# Altium project PowerBackup-v2.1.1.PrjPcb (part 1 of 2)
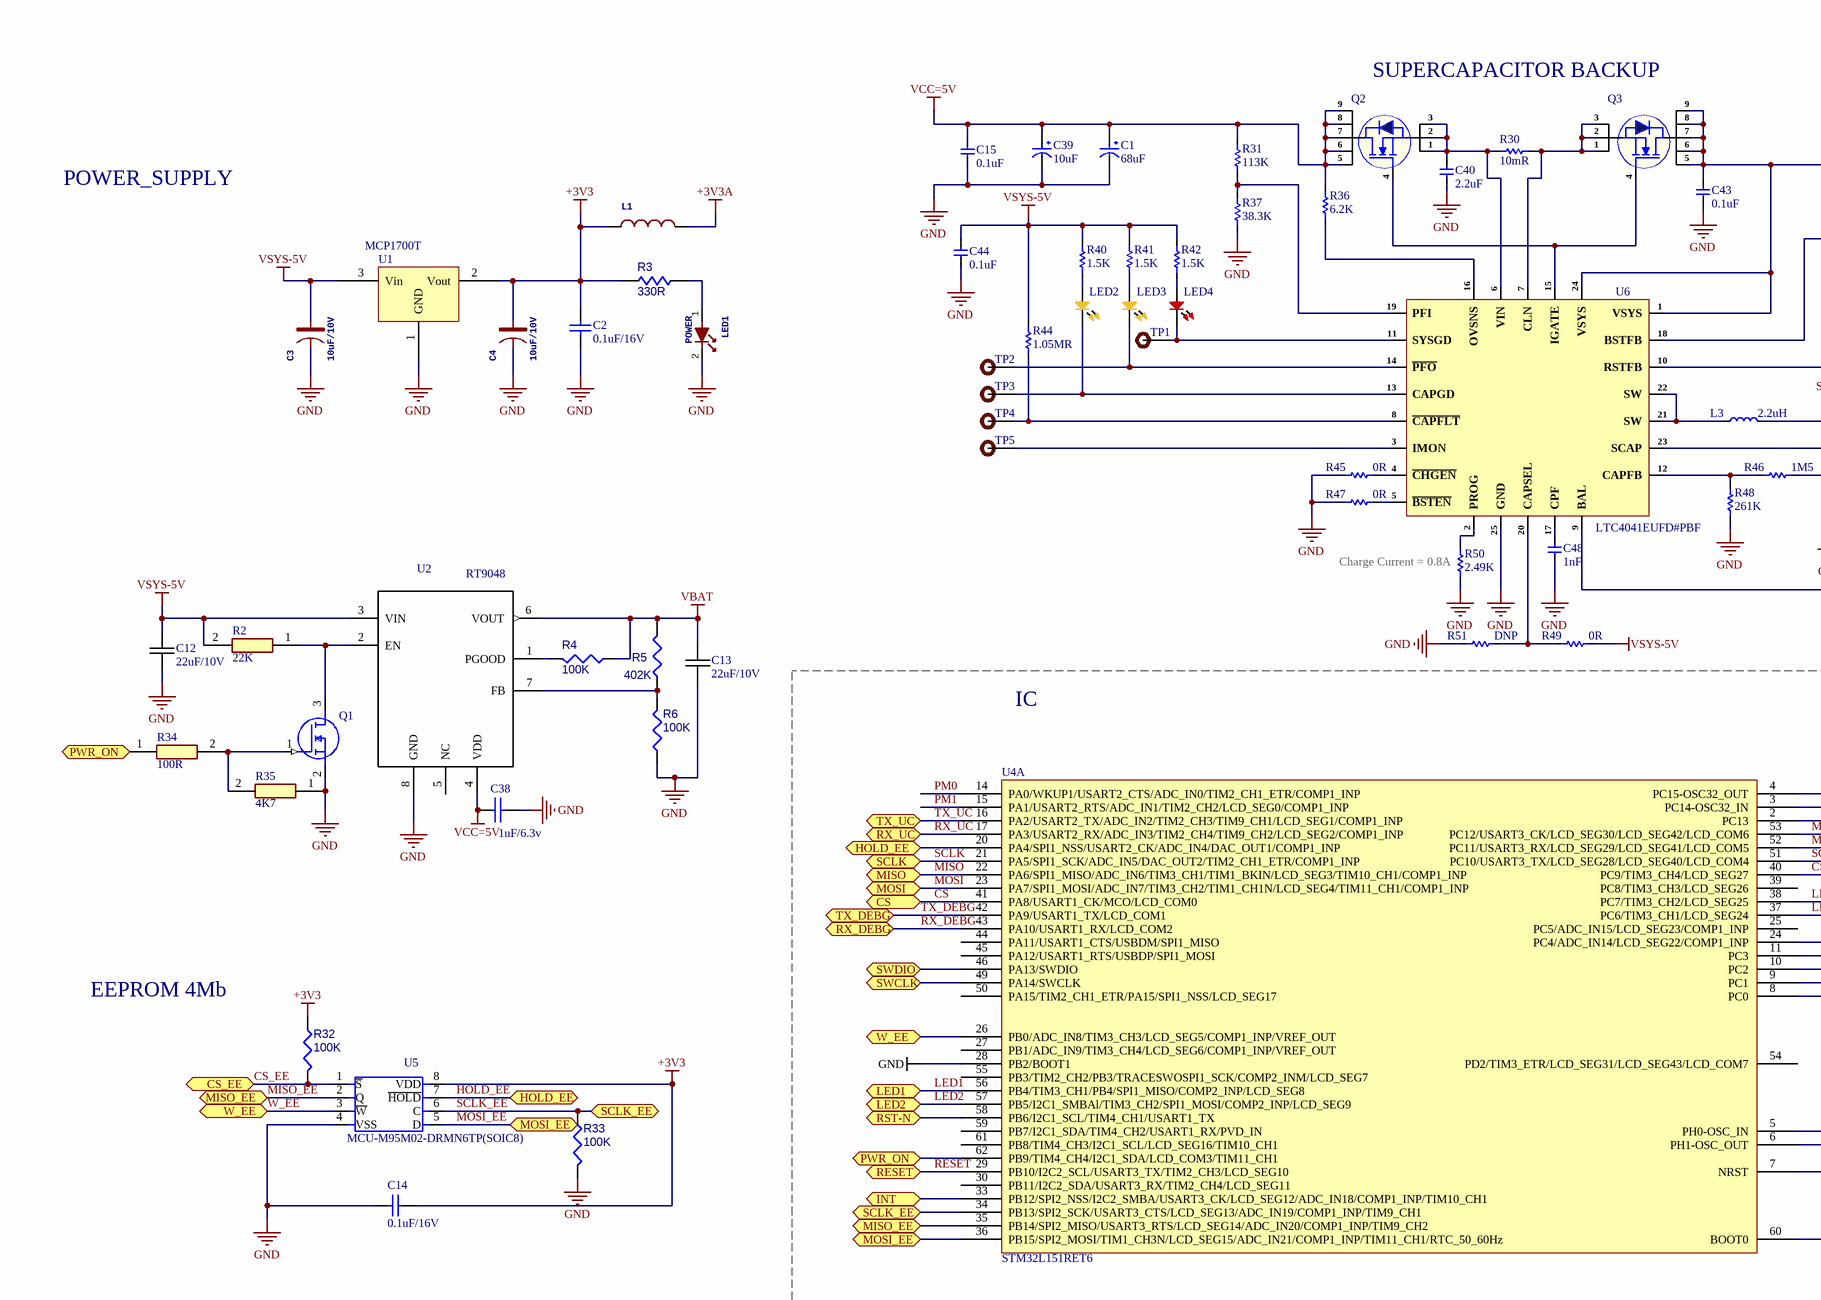
[diagram p0: Board3ph.SchDoc, top left]
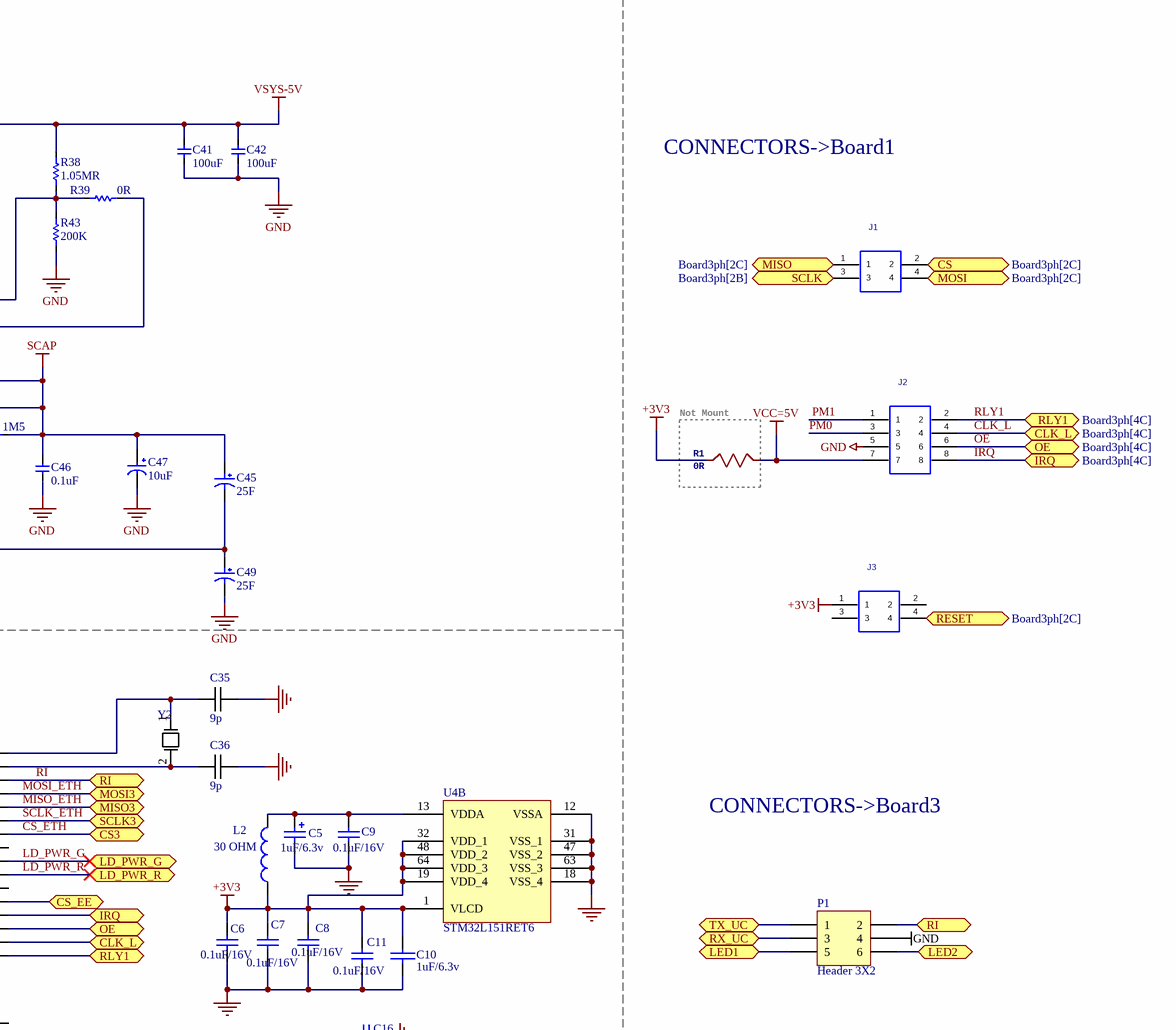
[diagram p1: Board3ph.SchDoc, top right]
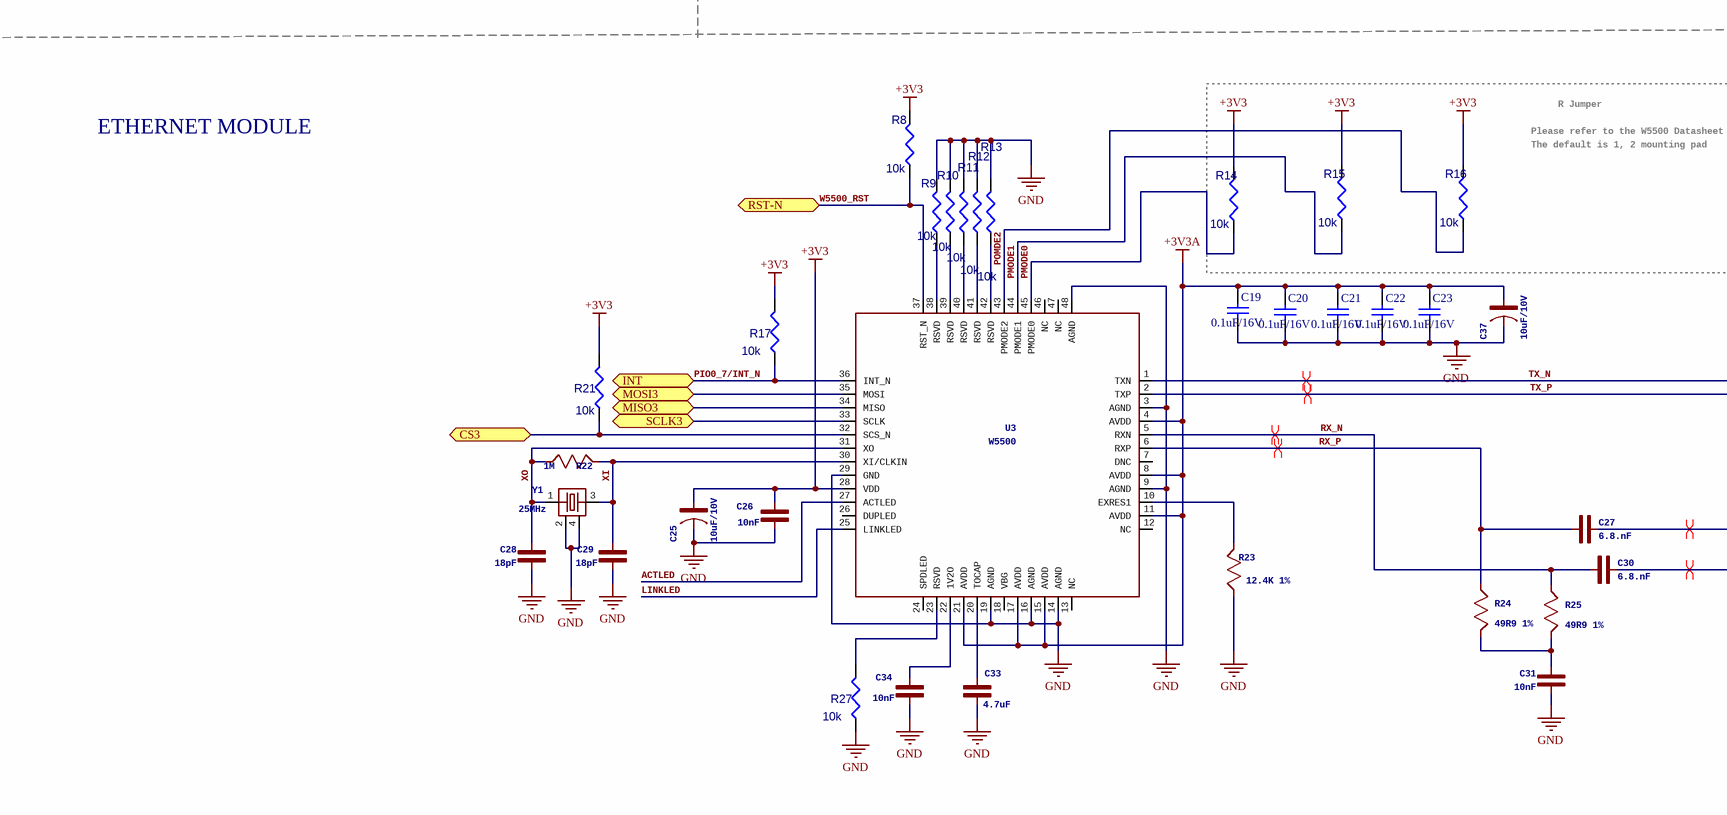
[diagram p2: Board3ph.SchDoc, bottom left]
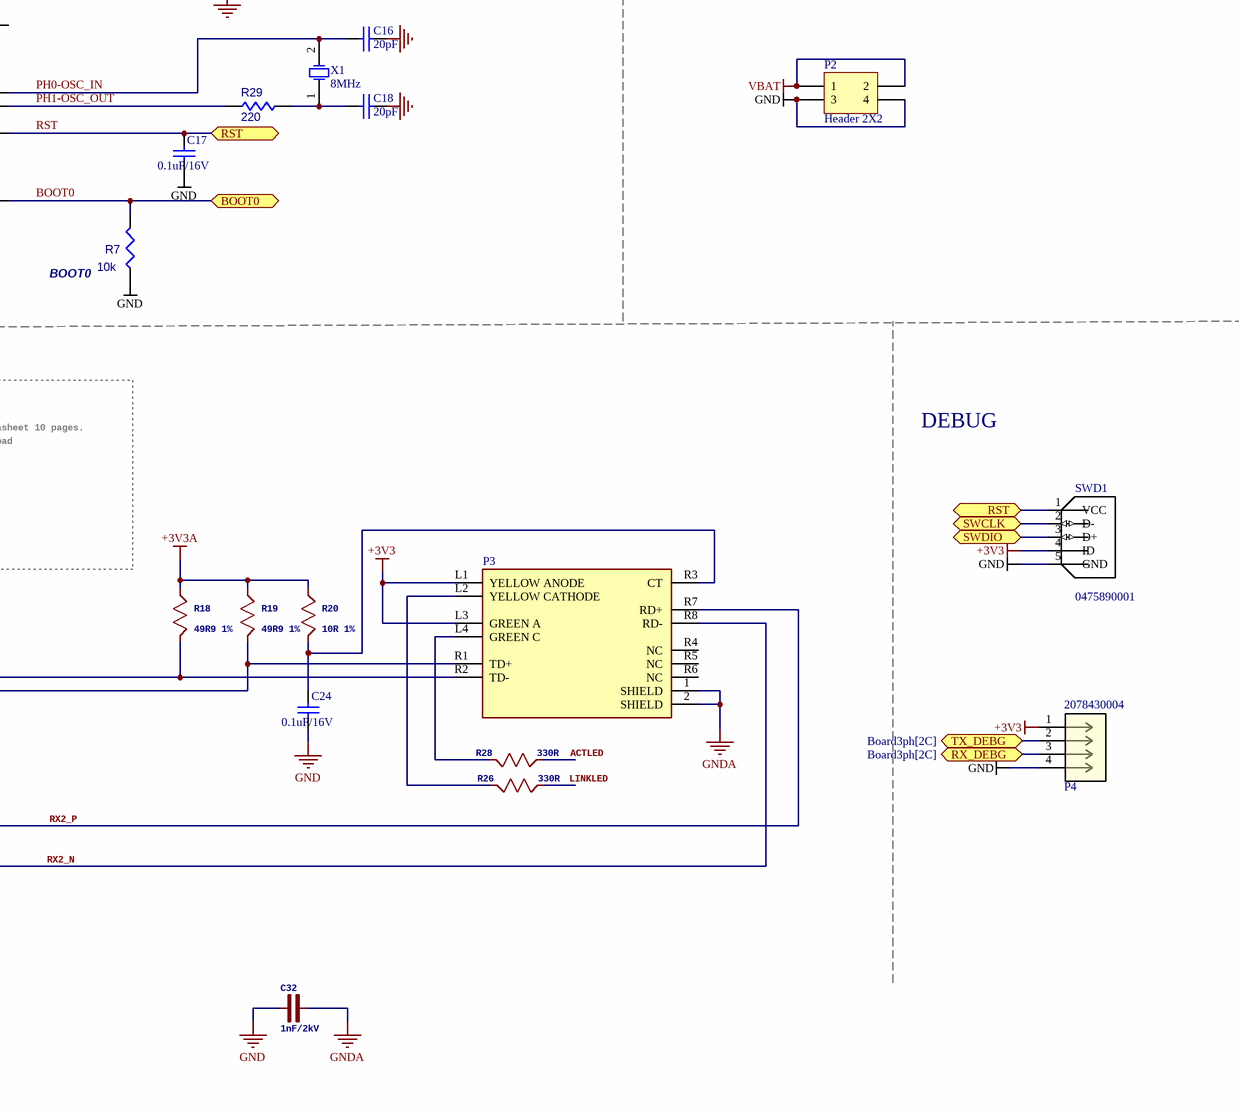
[diagram p3: Board3ph.SchDoc, bottom right]
1 sheet, 132 parts. Net scope: flat (ports and power ports of the same name join across sheets).
Board file: Board3ph.PcbDoc

## Sheet Board3ph.SchDoc
size 594 x 420 mm; DrawnBy: A.C; Address1: WATTNOW Rue Lac Victoria; Address2: Les Berges du Lac, Tunisia.; Revision: B; SheetNumber: 1; SheetTotal: 1; EDA_Number: WN-XXXXX-VX-X; Projet: AC Energy Meter; ModifiedBy: -; CreateDate: 07/05/2020; CheckedDate: -; Title2: Daughter Board B; DivGrp: WN; Designer: A.C

### Parts
C1  68uF  [Case-C]
C2  0.1uF/16V  [0603C-TBD]
C3  10uF/10V  [C-3216(TANTAL) - INV]
C4  10uF/10V  [C-3216(TANTAL) - INV]
C5  1uF/6.3v  [C-2012 - TANT]
C6  0.1uF/16V  [0603C-TBD]
C7  0.1uF/16V  [0603C-TBD]
C8  0.1uF/16V  [0603C-TBD]
C9  0.1uF/16V  [0603C-TBD]
C10  1uF/6.3v  [0603C-TBD]
C11  0.1uF/16V  [0603C-TBD]
C12  22uF/10V  [C-3216(TANTAL)]
C13  22uF/10V  [C-3216(TANTAL)]
C14  0.1uF/16V  [0603C-TBD]
C15  0.1uF  [Cap-0603]
C16  20pF  [0603C-TBD]
C17  0.1uF/16V  [0603C-TBD]
C18  20pF  [0603C-TBD]
C19  0.1uF/16V  [0603C-TBD]
C20  0.1uF/16V  [0603C-TBD]
C21  0.1uF/16V  [0603C-TBD]
C22  0.1uF/16V  [0603C-TBD]
C23  0.1uF/16V  [0603C-TBD]
C24  0.1uF/16V  [0603C-TBD]
C25  10uF/10V  [C-3216(TANTAL)]
C26  10nF  [C-1608]
C27  6.8.nF  [C-1608]
C28  18pF  [C-1608]
C29  18pF  [C-1608]
C30  6.8.nF  [C-1608]
C31  10nF  [C-1608]
C32  1nF/2kV  [C-2012]
C33  4.7uF  [0603C-TBD]
C34  10nF  [C-1608]
C35  9p  [0603C-TBD]
C36  9p  [0603C-TBD]
C37  10uF/10V  [C-3216(TANTAL)]
C38  1uF/6.3v  [0603C-TBD]
C39  10uF  [Case-A]
C40  2.2uF  [Cap-0805]
C41  100uF  [Cap-1210]
C42  100uF  [Cap-1210]
C43  0.1uF  [Cap-0603]
C44  0.1uF  [Cap-0603]
C45  25F  [DGH256Q2R7]
C46  0.1uF  [Cap-0603]
C47  10uF  [Case-A]
C48  1nF  [Cap-0402]
C49  25F  [DGH256Q2R7]
J1  SFMC-102-X1-XX-D  [SFMC-102-X1-XX-D]  (value not drawn)
J2  SFMC-104-X1-XX-D  [SFMC-104-X1-XX-D]  (value not drawn)
J3  SFMC-102-X1-XX-D  [SFMC-102-X1-XX-D]  (value not drawn)
L1  GLFR1608T1R5M-LR  [L-1608]  (value not drawn)
L2  30 OHM  [0603C-TBD]
L3  2.2uH  [MS0650-2R2M-C]
LED1  POWER  [LED-1608]
LED2  Yellow  [LED-0603]  (value not drawn)
LED3  Yellow  [LED-0603]  (value not drawn)
LED4  RED  [LED-0603]  (value not drawn)
P1  Header 3X2  [3x2A 1.27 Double Samtec]
P2  Header 2X2  [2x2A 1.27 Double Samtec]
P3  Conn_WIZnet_RB1-125BAG1A_eec  [WIZnet_RB1-125BAG1A_0]  (value not drawn)
P4  2078430004  [CON_2078430004_MOL]
Q1  2N7002  [SOT23]  (value not drawn)
Q2  SIS488DN-T1-GE3  [PowerPAK® 1212-8]  (value not drawn)
Q3  SIS488DN-T1-GE3  [PowerPAK® 1212-8]  (value not drawn)
R1  0R  [R-1608]
R2  22K  [0603C-TBD]
R3  330R  [0603C-TBD]
R4  100K  [0603C-TBD]
R5  402K  [0603C-TBD]
R6  100K  [0603C-TBD]
R7  10k  [0603C-TBD]
R8  10k  [0603C-TBD]
R9  10k  [0603C-TBD]
R10  10k  [0603C-TBD]
R11  10k  [0603C-TBD]
R12  10k  [0603C-TBD]
R13  10k  [0603C-TBD]
R14  10k  [0603C-TBD]
R15  10k  [0603C-TBD]
R16  10k  [0603C-TBD]
R17  10k  [0603C-TBD]
R18  49R9 1%  [R-1608]
R19  49R9 1%  [R-1608]
R20  10R 1%  [R-1608]
R21  10k  [0603C-TBD]
R22  1M  [R-1608]
R23  12.4K 1%  [R-1608]
R24  49R9 1%  [R-1608]
R25  49R9 1%  [R-1608]
R26  330R  [R-1608]
R27  10k  [0603C-TBD]
R28  330R  [R-1608]
R29  220  [0603C-TBD]
R30  10mR  [RES-0306]
R31  113K  [Res-0603]
R32  100K  [0603C-TBD]
R33  100K  [0603C-TBD]
R34  100R  [0603C-TBD]
R35  4K7  [0603C-TBD]
R36  6.2K  [Res-0402]
R37  38.3K  [Res-0603]
R38  1.05MR  [RES-0805]
R39  0R  [Res-0402]
R40  1.5K  [Res-0402]
R41  1.5K  [Res-0402]
R42  1.5K  [Res-0402]
R43  200K  [RES-0805]
R44  1.05MR  [RES-0805]
R45  0R  [Res-0402]
R46  1M5  [Res-0603]
R47  0R  [Res-0402]
R48  261K  [Res-0402]
R49  0R  [Res-0402]
R50  2.49K  [Res-0402]
R51  DNP  [Res-0402]
SWD1  0475890001  [MOLEX_0475890001]
TP1  TEST POINT  [Test-point]  (value not drawn)  (no BOM)
TP2  TEST POINT  [Test-point]  (value not drawn)  (no BOM)
TP3  TEST POINT  [Test-point]  (value not drawn)  (no BOM)
TP4  TEST POINT  [Test-point]  (value not drawn)  (no BOM)
TP5  TEST POINT  [Test-point]  (value not drawn)  (no BOM)
U1  MCP1700T  [SOT23]
U2  RT9048  [SOIC127P600X175-8N]
U3  W5500  [W5500]
U4  STM32L151RET6  [STM-LQFP64_V]  (parts A,B of 2)
U5  MCU-M95M02-DRMN6TP(SOIC8)  [SOIC8-1.27-5X4MM]
U6  LTC4041EUFD#PBF  [24-QFN (4x5)]
X1  8MHz  [XTAL_HC49P488W43L1150T466H350]
Y1  25MHz  [XTAL3225]
Y2  CM8V-T1A-32.768KHZ-9PF-20PPM-TA-QC  [XTAL_CM8V-T1A-32.768KHZ-9PF-20PPM-TA-QC]  (value not drawn)

### Blocks framed on the sheet
Not Mount: R1

### Ports
BOOT0 (bidir), CLK_L (bidir, see Board3ph[4C]), CLK_L (bidir, see Board3ph[5B]), CS3 (bidir, see Board3ph[1E]), CS3 (bidir, see Board3ph[4C]), CS (bidir, see Board3ph[2C]), CS (bidir, see Board3ph[5A]), CS_EE (bidir, see Board3ph[1C]), CS_EE (bidir, see Board3ph[3C]), HOLD_EE (bidir, see Board3ph[1C]), HOLD_EE (bidir, see Board3ph[2B]), INT (bidir, see Board3ph[2C]), INT (bidir, see Board3ph[2D]), IRQ (bidir, see Board3ph[4C]), IRQ (bidir, see Board3ph[5B]), LD_PWR_G (bidir), LD_PWR_R (bidir), LED1 (bidir, see Board3ph[2C]), LED1 (bidir, see Board3ph[4C]), LED2 (bidir, see Board3ph[2C]), LED2 (bidir, see Board3ph[5C]), MISO3 (bidir, see Board3ph[2D]), MISO3 (bidir, see Board3ph[4B]), MISO (bidir, see Board3ph[2C]), MISO (bidir, see Board3ph[5A]), MISO_EE (bidir, see Board3ph[1C]), MISO_EE (bidir, see Board3ph[2C]), MOSI3 (bidir, see Board3ph[2D]), MOSI3 (bidir, see Board3ph[4B]), MOSI (bidir, see Board3ph[2C]), MOSI (bidir, see Board3ph[5A]), MOSI_EE (bidir, see Board3ph[1C]), MOSI_EE (bidir, see Board3ph[2C]), OE (bidir, see Board3ph[4C]), OE (bidir, see Board3ph[5B]), PWR_ON (bidir, see Board3ph[1B]), PWR_ON (bidir, see Board3ph[2C]), RESET (bidir, see Board3ph[2C]), RESET (bidir, see Board3ph[5B]), RI (bidir, see Board3ph[4B]), RI (bidir, see Board3ph[5C]), RLY1 (bidir, see Board3ph[4C]), RLY1 (bidir, see Board3ph[5B]), RST (bidir, see Board3ph[4C]), RST (bidir, see Board3ph[5D]), RST-N (bidir, see Board3ph[2C]), RST-N (bidir, see Board3ph[2D]), RX_DEBG (bidir, see Board3ph[2C]), RX_DEBG (bidir, see Board3ph[5E]), RX_UC (bidir, see Board3ph[2B]), RX_UC (bidir, see Board3ph[4C]), SCLK3 (bidir, see Board3ph[2D]), SCLK3 (bidir, see Board3ph[4B]), SCLK (bidir, see Board3ph[2B]), SCLK (bidir, see Board3ph[5A]), SCLK_EE (bidir, see Board3ph[1C]), SCLK_EE (bidir, see Board3ph[2C]), SWCLK (bidir, see Board3ph[2C]), SWCLK (bidir, see Board3ph[5D]), SWDIO (bidir, see Board3ph[2C]), SWDIO (bidir, see Board3ph[5D]), TX_DEBG (bidir, see Board3ph[2C]), TX_DEBG (bidir, see Board3ph[5E]), TX_UC (bidir, see Board3ph[2B]), TX_UC (bidir, see Board3ph[4C]), W_EE (bidir, see Board3ph[1C]), W_EE (bidir, see Board3ph[2C])

### Nets
+3V3: C2.2 C4.1 C6.2 C7.2 C8.2 C10.1 C11.2 C14.1 C25.1 C26.2(P$2) J3.1 L1.1 L2.1 P3.L1(YELLOW_ANODE) P3.L3(GREEN_A) P4.1 R1.2(P$2) R3.1 R8.2 R14.2 R15.2 R16.2 R17.2 R21.2 R32.1 SWD1.4(ID) U1.2(Vout) U3.28(VDD) U4.1(VLCD) U4.19(VDD_4) U4.32(VDD_1) U4.48(VDD_2) U4.64(VDD_3) U5.8(VDD)
+3V3A: C19.2 C20.2 C21.2 C22.2 C23.2 C37.1 L1.2 R18.2(P$2) R19.2(P$2) R20.2(P$2) U3.4(AVDD) U3.8(AVDD) U3.11(AVDD) U3.15(AVDD) U3.17(AVDD) U3.21(AVDD)
GND: C1.2 C2.1 C3.2 C4.2 C5.2 C6.1 C7.1 C8.1 C9.1 C10.2 C11.1 C12.1 C13.1 C14.2 C15.1 C16.1 C17.1 C18.1 C19.1 C20.1 C21.1 C22.1 C23.1 C24.1 C25.2 C26.1(P$1) C28.1(P$1) C29.1(P$1) C31.1(P$1) C32.1(P$1) C33.1 C34.1(P$1) C35.2 C36.2 C37.2 C38.2 C39.2 C40.1 C41.1 C42.1 C43.1 C44.1 C46.1 C47.2 C48.1 C49.2 J2.5 LED1.2(P$2) P1.4 P2.3 P2.4 P4.4 Q1.2(S) R6.1 R7.1 R9.2 R10.2 R11.2 R12.2 R13.2 R23.1(P$1) R27.1 R33.2 R35.1 R37.1 R43.1 R45.1 R47.1 R48.1 R50.1 R51.2 SWD1.5(GND) U1.1(GND) U2.8(GND) U3.3(AGND) U3.9(AGND) U3.14(AGND) U3.16(AGND) U3.19(AGND) U3.29(GND) U3.48(AGND) U4.12(VSSA) U4.18(VSS_4) U4.28(PB2/BOOT1) U4.31(VSS_1) U4.47(VSS_2) U4.63(VSS_3) U5.4(VSS) U6.25(GND) Y1.2 Y1.4
GNDA: C32.2(P$2) P3.1(SHIELD) P3.2(SHIELD)
SCAP: C45.1 C46.2 C47.1 L3.2 R46.2 U6.23(SCAP)
VBAT: C13.2 P2.1 P2.2 R4.1 R5.2 U2.6(VOUT)
VCC=5V: C1.1 C15.2 C38.1 C39.1 J2.7 Q2.5(D) Q2.6(D) Q2.7(D) Q2.8(D) Q2.9(D) R1.1(P$1) R31.2 R36.2 U2.4(VDD)
VSYS-5V: C3.1 C12.2 C41.2 C42.2 C43.2 C44.2 Q3.5(D) Q3.6(D) Q3.7(D) Q3.8(D) Q3.9(D) R2.2 R38.2 R40.2 R41.2 R42.2 R44.2 R49.1 U1.3(Vin) U2.3(VIN) U6.1(VSYS) U6.24(VSYS)
ACTLED: R28.2(P$2) U3.27(ACTLED)
BOOT0: R7.2 U4.60(BOOT0) ; port BOOT0
CLK_L: J2.4 U4.9(PC1) ; port CLK_L
CS: J1.2 U4.41(PA8/USART1_CK/MCO/LCD_COM0) ; port CS
CS_EE: R32.2 U4.24(PC4/ADC_IN14/LCD_SEG22/COMP1_INP) U5.1(~{S}) ; port CS_EE
CS_ETH: R21.1 U3.32(SCS_N) U4.40(PC9/TIM3_CH4/LCD_SEG27) ; port CS3
HOLD_EE: U4.20(PA4/SPI1_NSS/USART2_CK/ADC_IN4/DAC_OUT1/COMP1_INP) U5.7(~{HOLD}) ; port HOLD_EE
IRQ: J2.8 U4.11(PC3) ; port IRQ
LD_PWR_G: U4.38(PC7/TIM3_CH2/LCD_SEG25) ; port LD_PWR_G
LD_PWR_R: U4.37(PC6/TIM3_CH1/LCD_SEG24) ; port LD_PWR_R
LED1: P1.5 U4.56(PB4/TIM3_CH1/PB4/SPI1_MISO/COMP2_INP/LCD_SEG8) ; port LED1
LED2: P1.6 U4.57(PB5/I2C1_SMBAl/TIM3_CH2/SPI1_MOSI/COMP2_INP/LCD_SEG9) ; port LED2
LINKLED: R26.2(P$2) U3.25(LINKLED)
MISO: J1.1 U4.22(PA6/SPI1_MISO/ADC_IN6/TIM3_CH1/TIM1_BKIN/LCD_SEG3/TIM10_CH1/COMP1_INP) ; port MISO
MISO_EE: U4.35(PB14/SPI2_MISO/USART3_RTS/LCD_SEG14/ADC_IN20/COMP1_INP/TIM9_CH2) U5.2(Q) ; port MISO_EE
MISO_ETH: U3.34(MISO) U4.52(PC11/USART3_RX/LCD_SEG29/LCD_SEG41/LCD_COM5) ; port MISO3
MOSI: J1.4 U4.23(PA7/SPI1_MOSI/ADC_IN7/TIM3_CH2/TIM1_CH1N/LCD_SEG4/TIM11_CH1/COMP1_INP) ; port MOSI
MOSI_EE: U4.36(PB15/SPI2_MOSI/TIM1_CH3N/LCD_SEG15/ADC_IN21/COMP1_INP/TIM11_CH1/RTC_50_60Hz) U5.5(D) ; port MOSI_EE
MOSI_ETH: U3.35(MOSI) U4.53(PC12/USART3_CK/LCD_SEG30/LCD_SEG42/LCD_COM6) ; port MOSI3
OE: J2.6 U4.10(PC2) ; port OE
PH0-OSC_IN: C16.2 U4.5(PH0-OSC_IN) X1.2(OSC2)
PH1-OSC_OUT: R29.1 U4.6(PH1-OSC_OUT)
PIO0_7/INT_N: R17.1 U3.36(INT_N) U4.33(PB12/SPI2_NSS/I2C2_SMBA/USART3_CK/LCD_SEG12/ADC_IN18/COMP1_INP/TIM10_CH1) ; port INT
PM0: J2.3 U4.14(PA0/WKUP1/USART2_CTS/ADC_IN0/TIM2_CH1_ETR/COMP1_INP)
PM1: J2.1 U4.15(PA1/USART2_RTS/ADC_IN1/TIM2_CH2/LCD_SEG0/COMP1_INP)
PMODE0: R14.1 U3.45(PMODE0)
PMODE1: R15.1 U3.44(PMODE1)
POMDE2: R16.1 U3.43(PMODE2)
RESET: J3.4 U4.29(PB10/I2C2_SCL/USART3_TX/TIM2_CH3/LCD_SEG10) ; port RESET
RI: P1.2 U4.2(PC13) ; port RI
RLY1: J2.2 U4.8(PC0) ; port RLY1
RST: C17.2 SWD1.1(VCC) U4.7(NRST) ; port RST
RX2_N: C30.1(P$1) P3.R8(RD-)
RX2_P: C27.1(P$1) P3.R7(RD+)
RX_DEBG: P4.3 U4.43(PA10/USART1_RX/LCD_COM2) ; port RX_DEBG
RX_N: C30.2(P$2) R25.2(P$2) U3.5(RXN)
RX_P: C27.2(P$2) R24.2(P$2) U3.6(RXP)
RX_UC: P1.3 U4.17(PA3/USART2_RX/ADC_IN3/TIM2_CH4/TIM9_CH2/LCD_SEG2/COMP1_INP) ; port RX_UC
SCLK: J1.3 U4.21(PA5/SPI1_SCK/ADC_IN5/DAC_OUT2/TIM2_CH1_ETR/COMP1_INP) ; port SCLK
SCLK_EE: R33.1 U4.34(PB13/SPI2_SCK/USART3_CTS/LCD_SEG13/ADC_IN19/COMP1_INP/TIM9_CH1) U5.6(C) ; port SCLK_EE
SCLK_ETH: U3.33(SCLK) U4.51(PC10/USART3_TX/LCD_SEG28/LCD_SEG40/LCD_COM4) ; port SCLK3
TX_DEBG: P4.2 U4.42(PA9/USART1_TX/LCD_COM1) ; port TX_DEBG
TX_N: P3.R2(TD-) R18.1(P$1) U3.1(TXN)
TX_P: P3.R1(TD+) R19.1(P$1) U3.2(TXP)
TX_UC: P1.1 U4.16(PA2/USART2_TX/ADC_IN2/TIM2_CH3/TIM9_CH1/LCD_SEG1/COMP1_INP) ; port TX_UC
W5500_RST: R8.1 U3.37(RST_N) U4.58(PB6/I2C1_SCL/TIM4_CH1/USART1_TX) ; port RST-N
W_EE: U4.26(PB0/ADC_IN8/TIM3_CH3/LCD_SEG5/COMP1_INP/VREF_OUT) U5.3(~{W}) ; port W_EE
XI: C29.2(P$2) R22.2(P$2) U3.30(XI/CLKIN) Y1.3
XO: C28.2(P$2) R22.1(P$1) U3.31(XO) Y1.1
NetC5_1: C5.1 C9.2 L2.2 U4.13(VDDA)
NetC18_2: C18.2 R29.2 X1.1(OSC1)
NetC24_2: C24.2 P3.R3(CT) R20.1(P$1)
NetC31_2: C31.2(P$2) R24.1(P$1) R25.1(P$1)
NetC33_2: C33.2 U3.20(TOCAP)
NetC34_2: C34.2(P$2) U3.22(1V2O)
NetC35_1: C35.1 U4.4(PC15-OSC32_OUT) Y2.1
NetC36_1: C36.1 U4.3(PC14-OSC32_IN) Y2.2
NetC40_2: C40.2 Q2.1(S) Q2.2(S) Q2.3(S) R30.1 U6.6(VIN)
NetC45_2: C45.2 C49.1 U6.9(BAL)
NetC48_2: C48.2 U6.17(CPF)
NetL3_1: L3.1 U6.21(SW) U6.22(SW)
NetLED1_1: LED1.1(P$1) R3.2
NetLED2_1: LED2.1 R40.1
NetLED2_2: LED2.2 TP3.1 U6.13(CAPGD)
NetLED3_1: LED3.1 R41.1
NetLED3_2: LED3.2 TP2.1 U6.14(~{PFO})
NetLED4_1: LED4.1 R42.1
NetLED4_2: LED4.2 TP1.1 U6.11(SYSGD)
NetP3_L2: P3.L2(YELLOW_CATHODE) R26.1(P$1)
NetP3_L4: P3.L4(GREEN_C) R28.1(P$1)
NetQ1_1: Q1.1(G) R34.2 R35.2
NetQ1_3: Q1.3(D) R2.1 U2.2(EN)
NetQ2_4: Q2.4(G) Q3.4(G) U6.15(IGATE)
NetQ3_1: Q3.1(S) Q3.2(S) Q3.3(S) R30.2 U6.7(CLN)
NetR4_2: R4.2 U2.1(PGOOD)
NetR5_1: R5.1 R6.2 U2.7(FB)
NetR9_1: R9.1 U3.38(RSVD)
NetR10_1: R10.1 U3.39(RSVD)
NetR11_1: R11.1 U3.40(RSVD)
NetR12_1: R12.1 U3.41(RSVD)
NetR13_1: R13.1 U3.42(RSVD)
NetR23_2: R23.2(P$2) U3.10(EXRES1)
NetR27_2: R27.2 U3.23(RSVD)
NetR31_1: R31.1 R37.2 U6.19(PFI)
NetR34_1: R34.1 U4.62(PB9/TIM4_CH4/I2C1_SDA/LCD_COM3/TIM11_CH1) ; port PWR_ON
NetR36_1: R36.1 U6.16(OVSNS)
NetR38_1: R38.1 R39.1 R43.2 U6.18(BSTFB)
NetR39_2: R39.2 U6.10(RSTFB)
NetR44_1: R44.1 TP4.1 U6.8(~{CAPFLT})
NetR45_2: R45.2 U6.4(~{CHGEN})
NetR46_1: R46.1 R48.2 U6.12(CAPFB)
NetR47_2: R47.2 U6.5(~{BSTEN})
NetR49_2: R49.2 R51.1 U6.20(CAPSEL)
NetR50_2: R50.2 U6.2(PROG)
NetSWD1_2: SWD1.2(D-) U4.49(PA14/SWCLK) ; port SWCLK
NetSWD1_3: SWD1.3(D+) U4.46(PA13/SWDIO) ; port SWDIO
NetTP5_1: TP5.1 U6.3(IMON)

Not connected (* = marked no-connect by the designer): J3 2 3; P3 R4(NC) R5(NC) R6(NC); U2 5(NC); U3 7(DNC) 12(NC) 13(NC) 18(VBG) 24(SPDLED) 26(DUPLED) 46(NC) 47(NC); U4 25(PC5/ADC_IN15/LCD_SEG23/COMP1_INP) 27(PB1/ADC_IN9/TIM3_CH4/LCD_SEG6/COMP1_INP/VREF_OUT) 30(PB11/I2C2_SDA/USART3_RX/TIM2_CH4/LCD_SEG11) 39(PC8/TIM3_CH3/LCD_SEG26) 44(PA11/USART1_CTS/USBDM/SPI1_MISO) 45(PA12/USART1_RTS/USBDP/SPI1_MOSI) 50(PA15/TIM2_CH1_ETR/PA15/SPI1_NSS/LCD_SEG17) 54(PD2/TIM3_ETR/LCD_SEG31/LCD_SEG43/LCD_COM7) 55(PB3/TIM2_CH2/PB3/TRACESWOSPI1_SCK/COMP2_INM/LCD_SEG7) 59(PB7/I2C1_SDA/TIM4_CH2/USART1_RX/PVD_IN) 61(PB8/TIM4_CH3/I2C1_SCL/LCD_SEG16/TIM10_CH1)

### Layout directives
differential pair; net class Diff100: RX2_N, RX2_P, RX_N, RX_P, TX_N, TX_P

### Notes on the sheet
- SUPERCAPACITOR BACKUP
- POWER_SUPPLY
- CONNECTORS->Board1
- (near R50) Charge Current = 0.8A
- IC
- CONNECTORS->Board3
- EEPROM 4Mb
- (near R7) BOOT0
- ETHERNET MODULE
- Please refer to the W5500 Datasheet 10 pages.
- The default is 1, 2 mounting pad
- R Jumper
- DEBUG
- Project/Equipment
- Document
- File
- Designer
- Drawn by
- Check.by
- Last Mod.
- Print Date
- Sheet
- Size
- A2
- of
- Rev